# Altium project Studio_Clock_hv1.PrjPcb (part 3 of 3)

## Sheet POWER_Supply.SchDoc
size A3; SheetNumber: 10; SheetTotal: 16
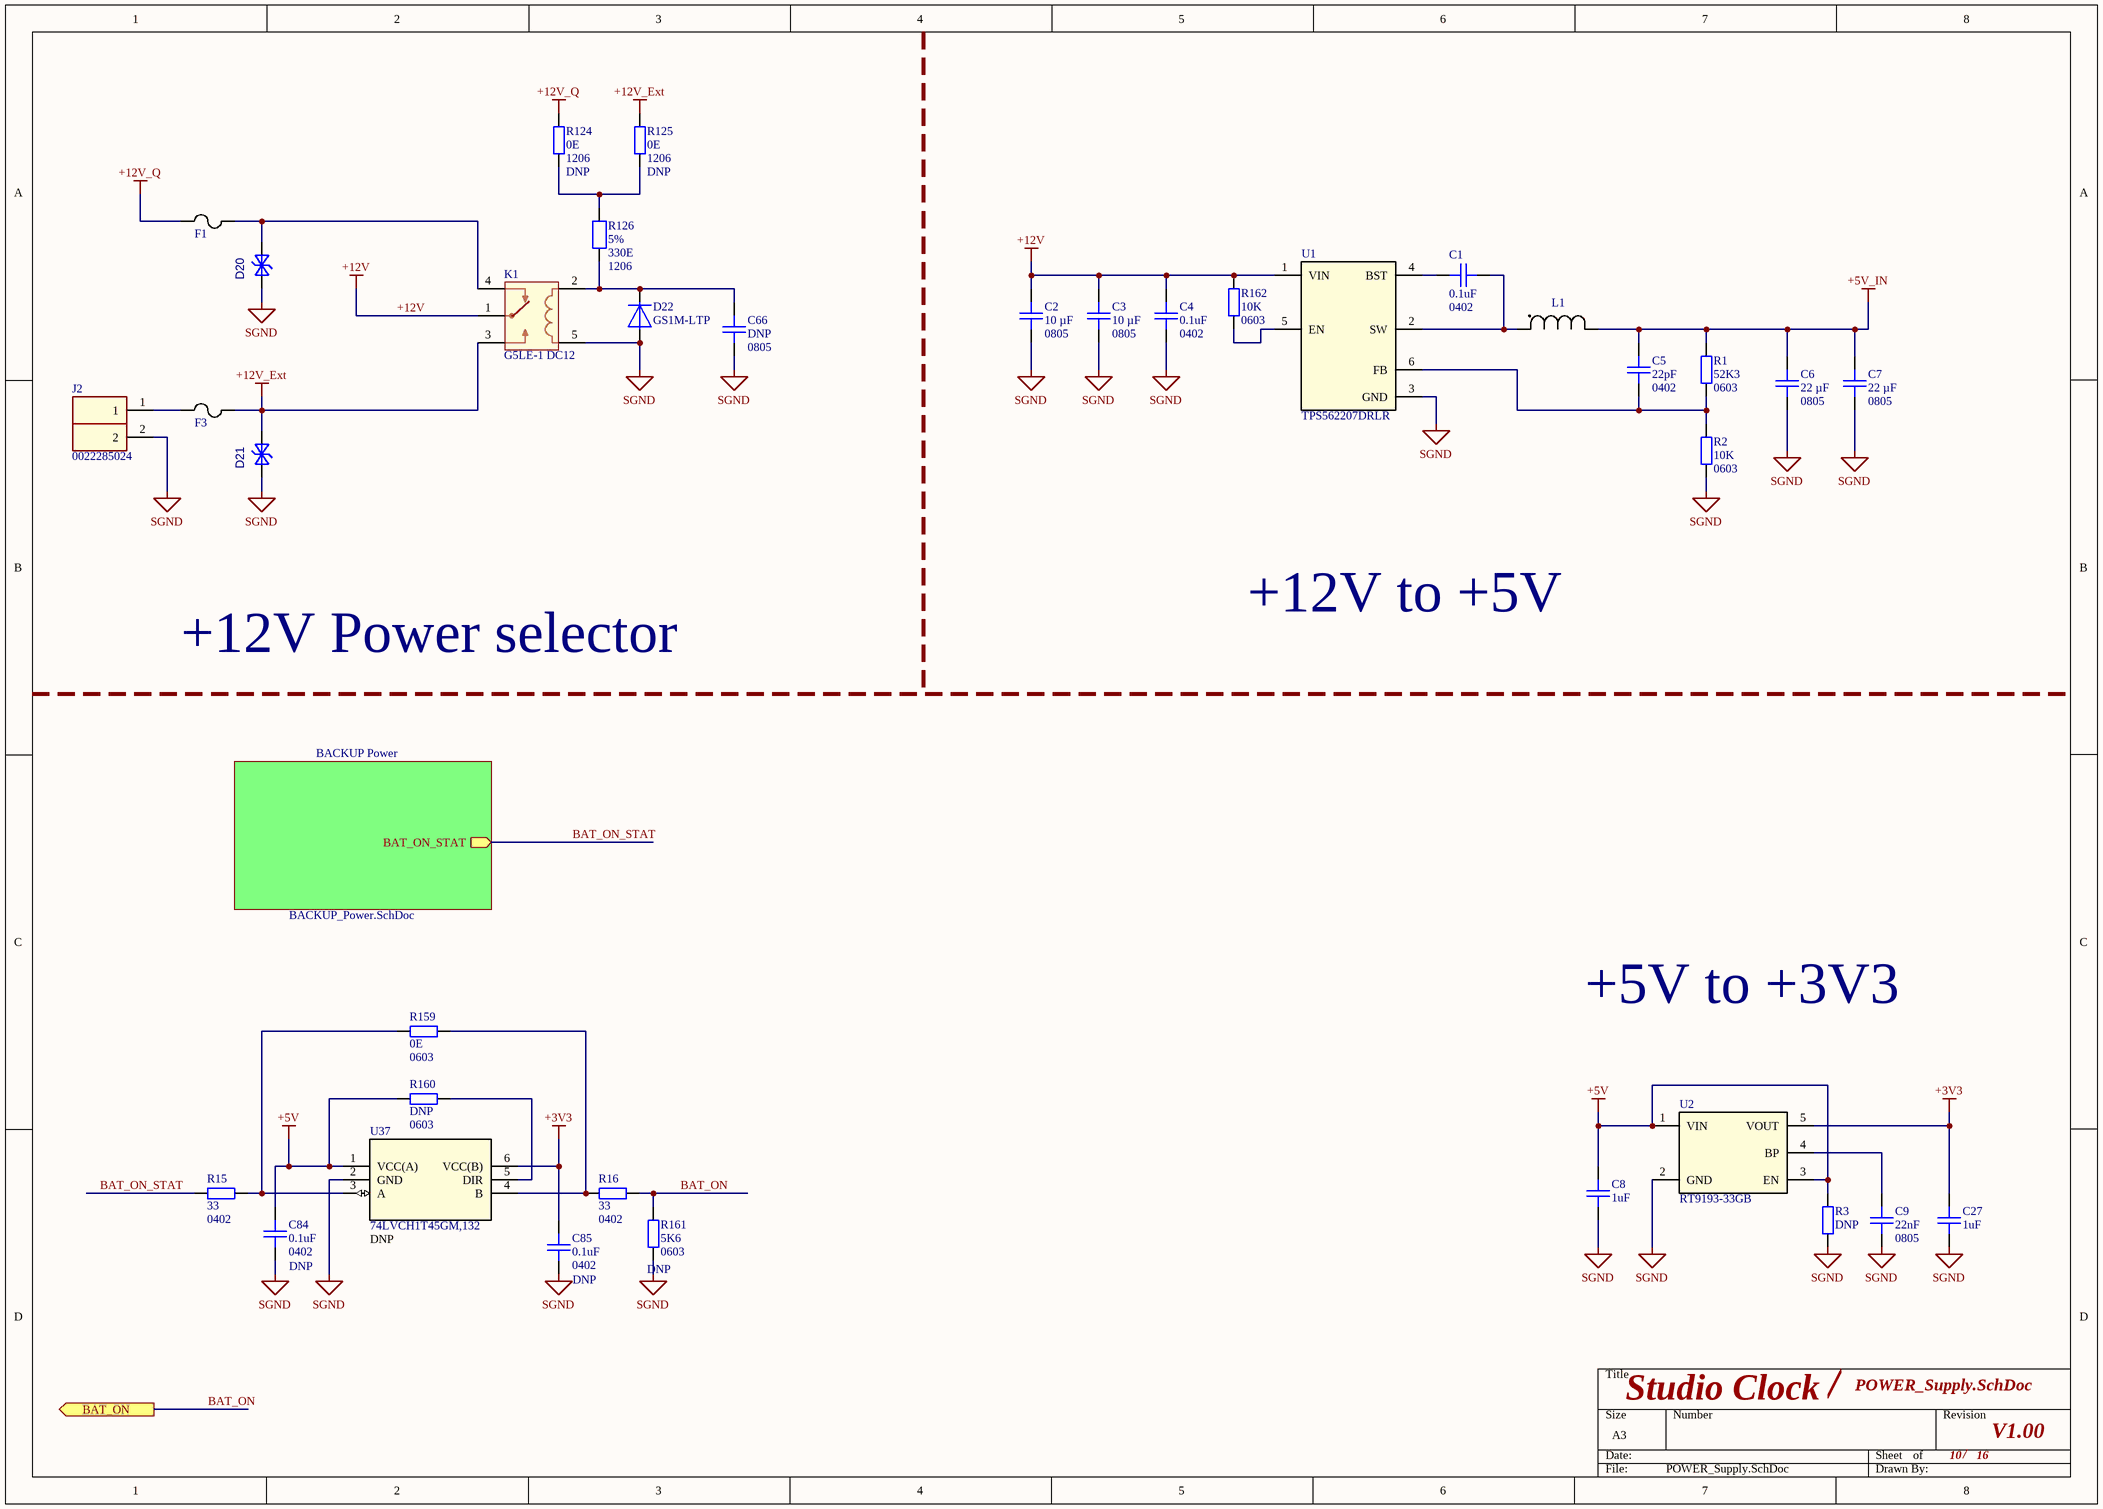
[diagram p13: POWER_Supply.SchDoc]

### Parts
C1  Capacitance: 0.1uF  Package1: 0402  [CAPC100x50x50L25]  (hidden comment: 04023C104KAT2A)
C2  Capacitance: 10 µF  Size2: 0805  [CAPC200X125X125L50]  (hidden comment: CC0805KKX5R8BB106)
C3  Capacitance: 10 µF  Size2: 0805  [CAPC200X125X125L50]  (hidden comment: CC0805KKX5R8BB106)
C4  Capacitance: 0.1uF  Package1: 0402  [CAPC100x50x50L25]  (hidden comment: 04023C104KAT2A)
C5  Capacitance: 22pF  Package1: 0402  [CAPC100x50x50L25]  (hidden comment: CC0402JRNPO9BN220)
C6  Capacitance: 22 µF  Size2: 0805  [CAPC200X125X125L50]  (hidden comment: GRT21BR61E226ME13L)
C7  Capacitance: 22 µF  Size2: 0805  [CAPC200X125X125L50]  (hidden comment: GRT21BR61E226ME13L)
C8  Capacitance: 1uF  [CAPC160X80X90L35]  (hidden comment: 0603YD105KAT2A)
C9  Capacitance: 22nF  SIZE2: 0805  [CAPC200X125X125L50]  (hidden comment: CC0805KRX7R9BB223)
C27  Capacitance: 1uF  [CAPC160X80X90L35]  (hidden comment: 0603YD105KAT2A)
C66  Capacitance: DNP  Size2: 0805  [CAPC200X125X125L50]
C84  Capacitance: 0.1uF  Package1: 0402  [CAPC100x50x50L25]  (hidden comment: DNP)
C85  Capacitance: 0.1uF  Package1: 0402  [CAPC100x50x50L25]  (hidden comment: DNP)
D20  SMAJ14CA-13-F  [SMA]  (value not drawn)
D21  SMAJ14CA-13-F  [SMA]  (value not drawn)
D22  GS1M-LTP  [DIOM520X260X290XL115X145]
F1  0ZCG0200AF2B  [Fuse_1812_ZCG_BEL]  (value not drawn)
F3  0ZCG0200AF2B  [Fuse_1812_ZCG_BEL]  (value not drawn)
J2  0022285024  [PLS-02]
K1  G5LE-1 DC12  [RELAY_G5LE-1 DC5_OMR]
L1  74437349047  [IND_7050-WE-LHMI_WRE]  (value not drawn)
R1  Resistance: 52K3  Size2: 0603  [RESC160X80X55L30]  (hidden comment: RC0603FR-0752K3L)
R2  Resistance: 10K  Size2: 0603  [RESC160X80X55L30]  (hidden comment: RC0603FR-0710KL)
R3  DNP  [RESC100X50X40L25]
R15  Resistance: 33  Package2: 0402  [RESC100X50X40L25]  (hidden comment: RC0402FR-0733RL)
R16  Resistance: 33  Package2: 0402  [RESC100X50X40L25]  (hidden comment: RC0402FR-0733RL)
R124  Resistance: 0E  Size2: 1206  PMNT: DNP  [RESC3116X06N]  (hidden comment: RC1206JR-070RL)
R125  Resistance: 0E  Size2: 1206  PMNT: DNP  [RESC3116X06N]  (hidden comment: RC1206JR-070RL)
R126  Tolerance: 5%  Resistance: 330E  Size: 1206  [RESC3116X06N]  (hidden comment: RC1206JR-07330RL)
R159  Resistance: 0E  Size2: 0603  [RESC160X80X55L30]  (hidden comment: RC0603FR-0710KL)
R160  Size2: 0603  [RESC160X80X55L30]  (hidden comment: DNP)
R161  Resistance: 5K6  Size2: 0603  [RESC160X80X55L30]  (hidden comment: CRCW06035K60JNEA)
R162  Resistance: 10K  Size2: 0603  [RESC160X80X55L30]  (hidden comment: RC0603FR-0710KL)
U1  TPS562207DRLR  [DRL0006A]
U2  RT9193-33GB  [SOT-23-5_RIT]
U37  74LVCH1T45GM,132  PMT: DNP  [74LVCH1T45_XSON6_NEX]

### Sub-sheets
BACKUP Power = BACKUP_Power.SchDoc: BAT_ON_STAT (out)

### Ports
BAT_ON (out)

### Nets
+3V3: C27.2 C85.2 U2.5(VOUT) U37.6(VCC(B))
+5V: C8.2 C84.2 R3.2 R160.2 U2.1(VIN) U2.3(EN) U37.1(VCC(A))
+5V_IN: C5.1 C6.2 C7.2 L1.2 R1.2
+12V: C2.2 C3.2 C4.1 K1.1 R162.1 U1.1(VIN)
+12V_Ext: D21.2(K) F3.2 K1.3 R125.2
+12V_Q: F1.1 R124.2
SGND: C2.1 C3.1 C4.2 C6.1 C7.1 C8.1 C9.1 C27.1 C66.1 C84.1 C85.1 D20.1(A) D21.1(A) D22.2 J2.2 K1.5 R2.1 R3.1 R161.1 U1.3(GND) U2.2(GND) U37.2(GND)
BAT_ON: R16.1 R161.2 ; port BAT_ON
BAT_ON_STAT: R15.2 ; sheet BACKUP Power/BAT_ON_STAT
NetC1_1: C1.1 L1.1 U1.2(SW)
NetC1_2: C1.2 U1.4(BST)
NetC5_2: C5.2 R1.1 R2.2 U1.6(FB)
NetC9_2: C9.2 U2.4(BP)
NetC66_2: C66.2 D22.1 K1.2 R126.2
NetD20_2: D20.2(K) F1.2 K1.4
NetF3_1: F3.1 J2.1
NetR15_1: R15.1 R159.2 U37.3(A)
NetR16_2: R16.2 R159.1 U37.4(B)
NetR124_1: R124.1 R125.1 R126.1
NetR160_1: R160.1 U37.5(DIR)
NetR162_2: R162.2 U1.5(EN)

### Notes on the sheet
- +12V to +5V
- +12V Power selector
- +5V to +3V3
- /

### Library data of the parts
C1 C4 C84 C85 = CMP-001-0374-4: 0402 25V X7R 100 NF 10%; Manufacturer: KYOCERA AVX; Op Temp max: 85°C; Op Temp min: -55°C; ComponentLink3URL: https://www.digikey.com/en/products/detail/yageo/CC0402MRX5R5BB106/5195138; ComponentLink1URL: https://www.yageo.com/upload/media/product/productsearch/datasheet/mlcc/UPY-GPHC_X5R_4V-to-50V_26.pdf; Package: 0402 (1005 Metric); Size: 1.00mm x 0.50mm; Height max: 700µm; Mounting Type: SM; Tolerance: 10%; ComponentLink1Description: Datasheet; ComponentLink3Description: Digikey; Ratings: -; Dielectric: X7R; ComponentLink2Description: Mouser; ComponentLink2URL: https://eu.mouser.com/ProductDetail/YAGEO/CC0402MRX5R5BB106?qs=zEY9bCHj09eCmUJdZuS5Lg%3D%3D; Lead Spacing: 0mm; Component Type: Ceramic Capacitor; Voltage Rating: 25V
  C1 C4: MPN: 04023C104KAT2A
  C84 C85: MPN: DNP; DNP: DNP
C2 C3 = CMP-001-1415-2: CAP CER 10UF 25V X5R 0805; Manufacturer: YAGEO; Op Temp max: 125°C; Op Temp min: -55°C; Tolerance: ±10%; Voltage Rating: 25V; Mounting Type: SM; MPN: CC0805KKX5R8BB106; Package: 0805 (2012 Metric); Dielectric: X5R; ComponentLink3Description: Digikey; ComponentLink1Description: Datasheet; Component Type: Ceramic Capacitor
  C2: ComponentLink1URL: https://www.yageo.com/upload/media/product/app/datasheet/mlcc/upy-gphc_x7r_6_3v-to-250v.pdf; ComponentLink3URL: https://www.digikey.ee/en/products/detail/yageo/cc0805krx7r9bb223/302872
  C3: ComponentLink1URL: https://www.yageo.com/upload/media/product/app/datasheet/mlcc/upy-gphc_x5r_4v-to-50v.pdf; ComponentLink3URL: https://www.digikey.com/en/products/detail/yageo/CC0805KKX5R8BB106/5195275
C5 = CMP-001-0374-4: CAP CER 22PF 50V C0G/NPO 0402; Manufacturer: YAGEO; Op Temp max: 125°C; Op Temp min: -55°C; Tolerance: 5%; Dielectric: C0G, NP0; ComponentLink3URL: https://www.digikey.com/en/products/detail/yageo/CC0402JRNPO9BN220/302752; MPN: CC0402JRNPO9BN220; ComponentLink1URL: https://www.yageo.com/upload/media/product/productsearch/datasheet/mlcc/UPY-GP_NP0_16V-to-50V_18.pdf; Package: 0402 (1005 Metric); Size: 1.00mm x 0.50mm; Height max: 700µm; Mounting Type: SM; ComponentLink1Description: Datasheet; ComponentLink3Description: Digikey; Ratings: -; Lead Spacing: 0mm; Component Type: Ceramic Capacitor; Voltage Rating: 50V
C6 C7 = CMP-001-1415-2: CAP CER 22UF 25V X5R 0805; Manufacturer: YAGEO; Op Temp max: 125°C; Op Temp min: -55°C; Tolerance: ±20%; Voltage Rating: 25V; ComponentLink1URL: https://search.murata.co.jp/Ceramy/image/img/A01X/G101/ENG/GRT21BR61E226ME13-01.pdf; ComponentLink3URL: https://www.digikey.com/en/products/detail/murata-electronics/GRT21BR61E226ME13L/5416811; Mounting Type: SM; MPN: GRT21BR61E226ME13L; Package: 0805 (2012 Metric); Dielectric: X5R; ComponentLink3Description: Digikey; ComponentLink1Description: Datasheet; Component Type: Ceramic Capacitor
C8 C27 = CMP-00119-5: CAP CER 1UF 16V X5R 0603; Manufacturer: KYOCERA AVX; Op Temp min: -55°C; Op Temp max: 85°C; Tolerance: 10%; ComponentLink1Description: Datasheet; MPN: 0603YD105KAT2A; ComponentLink2Description: Mouser; Ratings: -; Size: 1.60mm x 0.80mm; ComponentLink1URL: https://eu.mouser.com/datasheet/2/40/cx5r_KGM-3223198.pdf; Package: 0603 (1608 Metric); Dielectric: X5R; Voltage Rating: 16V; ComponentLink2URL: https://eu.mouser.com/ProductDetail/KYOCERA-AVX/0603YD105KAT2A?qs=Gc704lYbI0yxwip%252B5td8dA%3D%3D; Mounting Type: SM; Component Type: Ceramic Capacitor
C9 = CMP-001-1415-2: CAP CER 0.022UF 50V X7R 0805; MPN: CL21B104KBCNNNC; Manufacturer: Samsung Electro-Mechanics; Op Temp max: 125°C; Op Temp min: -55°C; Tolerance: ±10%; Voltage Rating: 50V; ComponentLink1URL: https://www.yageo.com/upload/media/product/app/datasheet/mlcc/upy-gphc_x7r_6_3v-to-250v.pdf; ComponentLink3URL: https://www.digikey.ee/en/products/detail/yageo/cc0805krx7r9bb223/302872; Mounting Type: SM; Package: 0805 (2012 Metric); Dielectric: X7R; ComponentLink3Description: Digikey; ComponentLink1Description: Datasheet; Ratings: -; Component Type: Ceramic Capacitor
C66 = CMP-001-1415-2: CAP CER ???? 50V X7R 0805; Manufacturer: Samsung Electro-Mechanics; Op Temp max: 125°C; Op Temp min: -55°C; Tolerance: ±10%; Voltage Rating: 50V; ComponentLink1URL: https://www.yageo.com/upload/media/product/app/datasheet/mlcc/upy-gphc_x7r_6_3v-to-250v.pdf; ComponentLink3URL: https://www.digikey.ee/en/products/detail/yageo/cc0805krx7r9bb223/302872; Mounting Type: SM; Package: 0805 (2012 Metric); Dielectric: X7R; ComponentLink3Description: Digikey; ComponentLink1Description: Datasheet; Component Type: Ceramic Capacitor; DNP: DNP
D20 D21 = SMAJ*C: TVS DIODE 14VWM 23.2VC SMA; MPN: SMAJ14CA-13-F
D22 = GS1M-LTP: DIODE GEN PURP 1KV 1A DO214AC; Manufacturer: Micro Commercial Co; Voltage - Forward (Vf) (Max) @ If: 1.1 V @ 1 A; Capacitance: 15pF @ 4V, 1MHz; Voltage - DC Reverse (Vr) (Max): 1000 V; Mounting Type: SM; ComponentLink3Description: Digikey; ComponentLink1Description: Datasheet; Diode Type: Diode; ComponentLink1URL: https://www.smc-diodes.com/propdf/1N4001FL-1N4007FL%20N1646%20REV.A.pdf; Package: DO-214AC, SMA; ComponentLink3URL: https://www.digikey.com/en/products/detail/micro-commercial-co/GS1M-LTP/2213582; Current - Average Rectified (Io): 1A; MPN: GS1M-LTP
F1 F3 = 0ZCG0200AF2B: PTC RESET FUSE 16V 2A 1812; Mfr_Name: Belfuse; Current - Trip (It): 3.5A; Resistance - Initial (Ri) (Min): 20 mOhms; Current - Hold (Ih) (Max): 2 A; MPN: 0ZCG0200AF2B; Voltage - Max: 16V; ComponentLink1Description: DigiKey; ComponentLink1URL: https://www.digikey.pl/en/products/detail/bel-fuse-inc/0ZCG0200AF2B/6210545; ComponentLink2Description: Datasheet; ComponentLink2URL: https://www.belfuse.com/resources/datasheets/circuitprotection/ds-cp-0zcg-series.pdf
J2 = PLS_02: CONN HEADER VERT 2POS 2.54MM; MAnufacturer: MOLEX; MPN: 0022285024
K1 = G5LE-1 DC12: RELAY GEN PURPOSE SPDT 10A 12V; Mfr_Name: Omron Electronics Inc-EMC Div; Copyright: Copyright (C) 2024 Ultra Librarian. All rights reserved.; MPN: G5LE-1 DC12; RefDes: RefDes; Type: DEV
L1 = IND_WE_74437349047: FIXED IND 4.7UH 5A 30.8 MOHM SMD; Mfr_Name: Wurth Electronics; Inductance: 4.7 µH; Current - Saturation (Isat): 11A; DC Resistance (DCR): 30.8mOhm Max; Manufacturer_Part_Number: 74437349047; Current Rating (Amps): 5 A; ComponentLink1Description: Datasheet; ComponentLink1URL: https://we-online.com/components/products/datasheet/74437349047.pdf; ComponentLink2Description: DigiKey; ComponentLink2URL: https://www.digikey.com/en/products/detail/w%C3%BCrth-elektronik/74437349047/2790977
R1 = CMP-001-0628-7: RES 52.3 KOHM 1% 1/10W 0603; Manufacturer: YAGEO; Power: 100mW; Temperature Coefficient: ±100ppm; Op Temp max: 155°C; Op Temp min: -55°C; Ratings: -; ComponentLink3URL: https://www.digikey.com/en/products/detail/yageo/RC0603FR-0710KL/726880?s=N4IgTCBcDaIEoGEAMA2JBmAYnAtEg7AIxIDSAMiALoC%2BQA; Size: 1.60mm x 0.80mm; ComponentLink1Description: Datasheet; ComponentLink3Description: Digikey; ComponentLink2Description: Mouser; ComponentLink1URL: https://www.yageo.com/upload/media/product/products/datasheet/rchip/PYu-RC_51_RoHS_P_4.pdf; Composition: Thick Film; Package: 0603 (1608 Metric); ComponentLink2URL: https://eu.mouser.com/ProductDetail/YAGEO/RC0603FR-0710KL?qs=grNVn54RoB%252B3GtjbJj3wJQ%3D%3D; Mounting Type: SM; Tolerance: 1%; Height max: 550µm; MPN: RC0603FR-0752K3L; Component Type: Chip Resistor
R2 R162 = CMP-001-0628-7: RES 10K OHM 1% 1/10W 0603; Manufacturer: YAGEO; Power: 100mW; Temperature Coefficient: ±100ppm; Op Temp max: 155°C; Op Temp min: -55°C; PMNT: DNP; Ratings: -; ComponentLink3URL: https://www.digikey.com/en/products/detail/yageo/RC0603FR-0710KL/726880?s=N4IgTCBcDaIEoGEAMA2JBmAYnAtEg7AIxIDSAMiALoC%2BQA; Size: 1.60mm x 0.80mm; ComponentLink1Description: Datasheet; ComponentLink3Description: Digikey; ComponentLink2Description: Mouser; ComponentLink1URL: https://www.yageo.com/upload/media/product/products/datasheet/rchip/PYu-RC_51_RoHS_P_4.pdf; Composition: Thick Film; Package: 0603 (1608 Metric); ComponentLink2URL: https://eu.mouser.com/ProductDetail/YAGEO/RC0603FR-0710KL?qs=grNVn54RoB%252B3GtjbJj3wJQ%3D%3D; Mounting Type: SM; Tolerance: 1%; Height max: 550µm; MPN: RC0603FR-0710KL; Component Type: Chip Resistor
R3 = CMP-001-0484-6: RES SMD 0 OHM JUMPER 1/16W 0402; Manufacturer: YAGEO; Power: 63mW; Op Temp min: -55°C; Temperature Coefficient: ±100ppm; Resistance: 0; Op Temp max: 155°C; ComponentLink3URL: https://www.digikey.com/en/products/detail/yageo/RC0402FR-0727RL/5280946; ComponentLink2Description: Mouser; Ratings: -; Tolerance: Jumper; Height max: 400µm; MPN: DNP; ComponentLink1URL: https://www.yageo.com/upload/media/product/productsearch/datasheet/rchip/PYu-RC_Group_51_RoHS_L_12.pdf; Size: 1.00mm x 0.50mm; Composition: Thick Film; Package: 0402 (1005 Metric); ComponentLink3Description: Digikey; Mounting Type: SM; ComponentLink2URL: https://eu.mouser.com/ProductDetail/YAGEO/RC0402FR-0727RL?qs=UOUeRUa%252B8Wlb37UyFHw9Bw%3D%3D; ComponentLink1Description: Datasheet; Component Type: Chip Resistor
R15 R16 = CMP-001-0484-6: RES 33 OHM 1% 1/16W 0402; Manufacturer: YAGEO; Power: 63mW; Op Temp min: -55°C; Temperature Coefficient: ±100ppm; Op Temp max: 155°C; ComponentLink3URL: https://www.digikey.com/en/products/detail/yageo/RC0402FR-0727RL/5280946; ComponentLink2Description: Mouser; Ratings: -; Tolerance: 1%; Height max: 400µm; MPN: RC0402FR-0733RL; ComponentLink1URL: https://www.yageo.com/upload/media/product/productsearch/datasheet/rchip/PYu-RC_Group_51_RoHS_L_12.pdf; Size: 1.00mm x 0.50mm; Composition: Thick Film; Package: 0402 (1005 Metric); ComponentLink3Description: Digikey; Mounting Type: SM; ComponentLink2URL: https://eu.mouser.com/ProductDetail/YAGEO/RC0402FR-0727RL?qs=UOUeRUa%252B8Wlb37UyFHw9Bw%3D%3D; ComponentLink1Description: Datasheet; Component Type: Chip Resistor
R124 R125 = RC_1206: RES 0 OHM JUMPER 1/4W 1206; MF: YAGEO; Power: 0.25W; Datasheet: https://www.yageo.com/upload/media/product/products/datasheet/rchip/PYu-RC_Group_51_RoHS_L_12.pdf; DigiKey: https://www.digikey.com/en/products/detail/yageo/RC1206JR-070RL/729184; Package: 1206 (3216 Metric); MPN: RC1206JR-070RL; DNP: DNP
R126 = RT1206BRD07100RL: RES 330 OHM 5% 1/4W 1206; MF: YAGEO; Power: 0.25W; Datasheet: https://www.yageo.com/upload/media/product/app/datasheet/rchip/pyu-rt_1-to-0.01_rohs_l.pdf; DigiKey: https://www.digikey.sk/en/products/detail/yageo/RT1206BRD07130RL/1079510; Package: 1206 (3216 Metric); MPN: RC1206JR-07330RL
R159 = CMP-001-0628-7: RES 0 OHM JUMPER 1/10W 0603; Manufacturer: YAGEO; Power: 100mW; Temperature Coefficient: ±100ppm; Tolerance: 1%; Op Temp max: 155°C; Op Temp min: -55°C; PMNT: DNP; Ratings: -; ComponentLink3URL: https://www.digikey.com/en/products/detail/yageo/RC0603FR-0710KL/726880?s=N4IgTCBcDaIEoGEAMA2JBmAYnAtEg7AIxIDSAMiALoC%2BQA; Size: 1.60mm x 0.80mm; ComponentLink1Description: Datasheet; ComponentLink3Description: Digikey; ComponentLink2Description: Mouser; ComponentLink1URL: https://www.yageo.com/upload/media/product/products/datasheet/rchip/PYu-RC_51_RoHS_P_4.pdf; Composition: Thick Film; Package: 0603 (1608 Metric); ComponentLink2URL: https://eu.mouser.com/ProductDetail/YAGEO/RC0603FR-0710KL?qs=grNVn54RoB%252B3GtjbJj3wJQ%3D%3D; Mounting Type: SM; Height max: 550µm; MPN: RC0603FR-0710KL; Component Type: Chip Resistor
R160 = CMP-001-0628-7: RES 0 OHM JUMPER 1/10W 0603; Manufacturer: YAGEO; MPN: RC0603FR-0710KL; Power: 100mW; Temperature Coefficient: ±100ppm; Tolerance: 1%; Op Temp max: 155°C; Op Temp min: -55°C; Ratings: -; ComponentLink3URL: https://www.digikey.com/en/products/detail/yageo/RC0603FR-0710KL/726880?s=N4IgTCBcDaIEoGEAMA2JBmAYnAtEg7AIxIDSAMiALoC%2BQA; Size: 1.60mm x 0.80mm; ComponentLink1Description: Datasheet; ComponentLink3Description: Digikey; ComponentLink2Description: Mouser; ComponentLink1URL: https://www.yageo.com/upload/media/product/products/datasheet/rchip/PYu-RC_51_RoHS_P_4.pdf; Resistance: DNP; Composition: Thick Film; Package: 0603 (1608 Metric); ComponentLink2URL: https://eu.mouser.com/ProductDetail/YAGEO/RC0603FR-0710KL?qs=grNVn54RoB%252B3GtjbJj3wJQ%3D%3D; Mounting Type: SM; Height max: 550µm; Component Type: Chip Resistor; PMNT: DNP; DNP: DNP
R161 = CMP-001-0628-7: RES SMD 5.6K OHM 5% 1/10W 0603; Manufacturer: YAGEO; MPN: DNP; Power: 100mW; Temperature Coefficient: ±100ppm; Tolerance: 1%; Op Temp max: 155°C; Op Temp min: -55°C; Ratings: -; ComponentLink3URL: https://www.digikey.com/en/products/detail/yageo/RC0603FR-0710KL/726880?s=N4IgTCBcDaIEoGEAMA2JBmAYnAtEg7AIxIDSAMiALoC%2BQA; Size: 1.60mm x 0.80mm; ComponentLink1Description: Datasheet; ComponentLink3Description: Digikey; ComponentLink2Description: Mouser; ComponentLink1URL: https://www.yageo.com/upload/media/product/products/datasheet/rchip/PYu-RC_51_RoHS_P_4.pdf; Composition: Thick Film; Package: 0603 (1608 Metric); ComponentLink2URL: https://eu.mouser.com/ProductDetail/YAGEO/RC0603FR-0710KL?qs=grNVn54RoB%252B3GtjbJj3wJQ%3D%3D; Mounting Type: SM; Height max: 550µm; Component Type: Chip Resistor; DNP: DNP
U1 = TPS562207DRLR: IC REG BUCK ADJ 2A SOT563; Mfr_Name: Texas Instruments; Voltage - Input (Max): 17V; Voltage - Input (Min): 4.3V; Frequency - Switching: 580kHz; Current - Output: 2A; MPN: TPS562207DRLR; ComponentLink1Description: DigiKey; ComponentLink1URL: https://www.digikey.com/en/products/detail/texas-instruments/tps562207drlr/13213542
U2 = RT9193-33GB: IC REG LINEAR 3.3V 300MA SOT23-5; Mfr_Name: Richtek Technology; MPN: RT9193-33GB
U37 = 74LVCH1T45GM,132: IC TRANSLTR BIDIRECTIONAL 6XSON; Voltage min: 1.2 V; Moltage max: 5.5 V; MPN: 74LVCH1T45GM,132; DNP: DNP

## Sheet BACKUP_Power.SchDoc
size A3; SheetNumber: 11; SheetTotal: 16
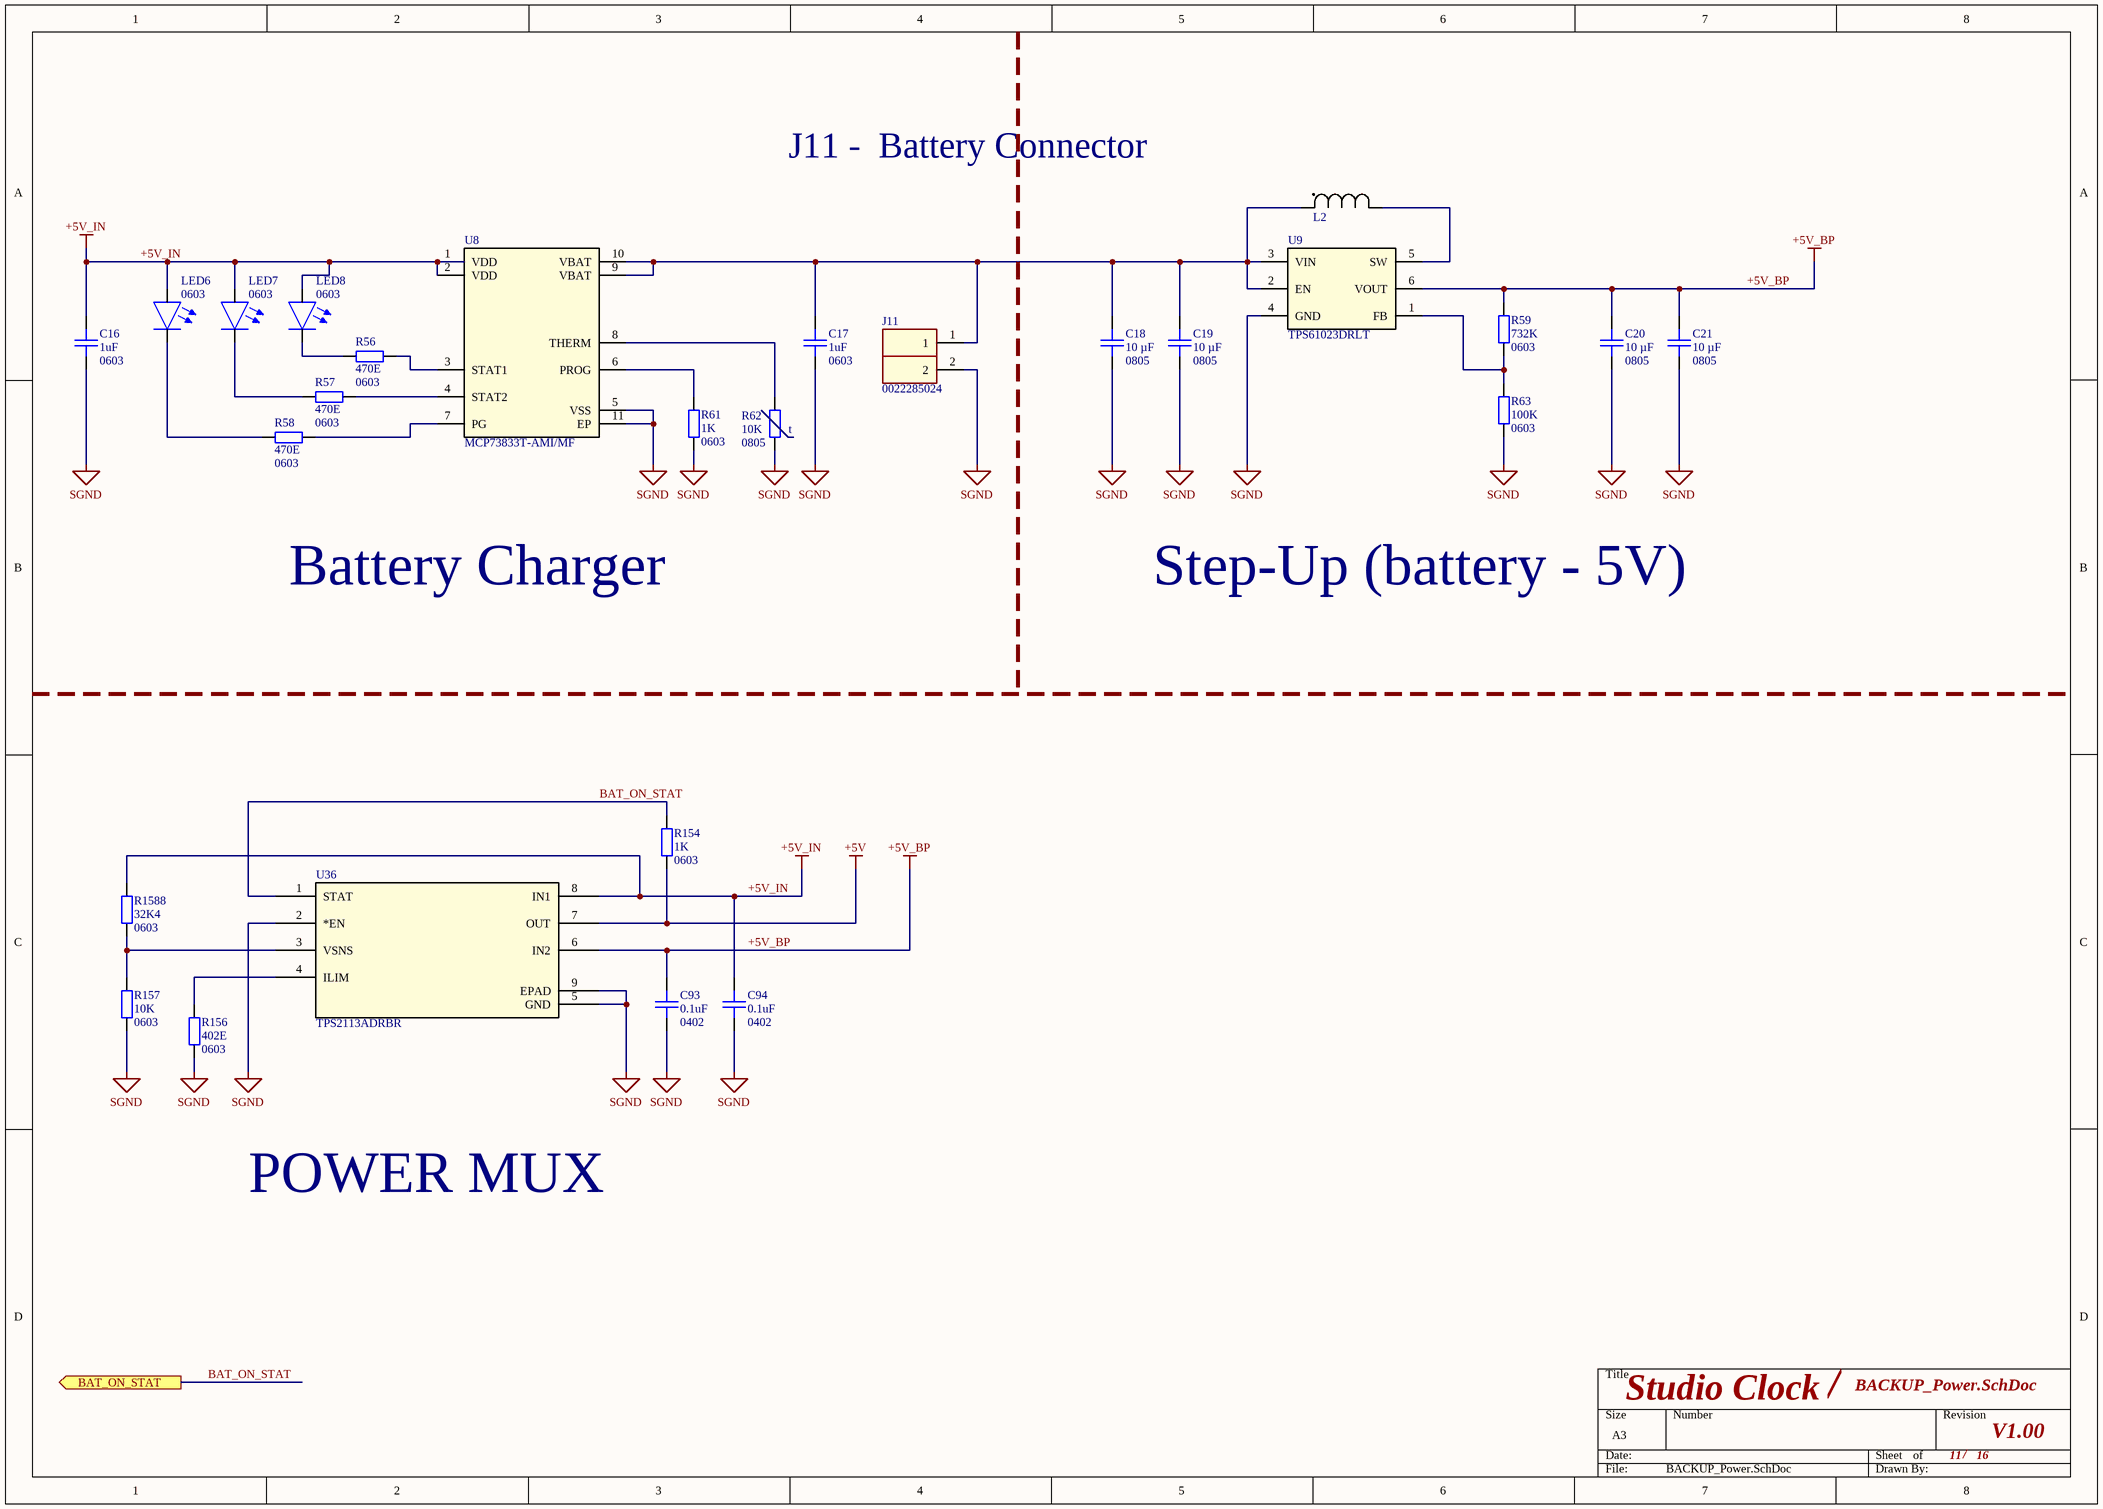
[diagram p14: BACKUP_Power.SchDoc]

### Parts
C16  Capacitance: 1uF  Size2: 0603  [CAPC160X80X90L35]  (hidden comment: KGM15AR71C105KT)
C17  Capacitance: 1uF  Size2: 0603  [CAPC160X80X90L35]  (hidden comment: KGM15AR71C105KT)
C18  Capacitance: 10 µF  Size2: 0805  [CAPC200X125X125L50]  (hidden comment: CC0805KKX5R8BB106)
C19  Capacitance: 10 µF  Size2: 0805  [CAPC200X125X125L50]  (hidden comment: CC0805KKX5R8BB106)
C20  Capacitance: 10 µF  Size2: 0805  [CAPC200X125X125L50]  (hidden comment: CC0805KKX5R8BB106)
C21  Capacitance: 10 µF  Size2: 0805  [CAPC200X125X125L50]  (hidden comment: CC0805KKX5R8BB106)
C93  Capacitance: 0.1uF  Package1: 0402  [CAPC100x50x50L25]  (hidden comment: 04023C104KAT2A)
C94  Capacitance: 0.1uF  Package1: 0402  [CAPC100x50x50L25]  (hidden comment: 04023C104KAT2A)
J11  0022285024  [PLS-02]
L2  XEL4030-101MEB  [IND_XEL4030_3.2_COC]  (value not drawn)
LED6  Size: 0603  [LED_0603(1608)]  (hidden comment: 150060GS75000)
LED7  Size: 0603  [LED_0603(1608)]  (hidden comment: 150060GS75000)
LED8  Size: 0603  [LED_0603(1608)]  (hidden comment: 150060GS75000)
R56  Resistance: 470E  Size2: 0603  [RESC160X80X55L30]  (hidden comment: RC0603FR-07470RL)
R57  Resistance: 470E  Size2: 0603  [RESC160X80X55L30]  (hidden comment: RC0603FR-07470RL)
R58  Resistance: 470E  Size2: 0603  [RESC160X80X55L30]  (hidden comment: RC0603FR-07470RL)
R59  Resistance: 732K  Size2: 0603  [RESC160X80X55L30]  (hidden comment: RC0603FR-07732KL)
R61  Resistance: 1K  Size2: 0603  [RESC160X80X55L30]  (hidden comment: RC0603FR-071KL)
R62  Resistance: 10K  Size2: 0805  [RESC200X125X60L40]  (hidden comment: NTCS0805E3103HMT)
R63  Resistance: 100K  Size2: 0603  [RESC160X80X55L30]  (hidden comment: RC0603FR-07100KL)
R154  Resistance: 1K  Size2: 0603  [RESC160X80X55L30]  (hidden comment: RC0603FR-071KL)
R156  Resistance: 402E  Size2: 0603  [RESC160X80X55L30]  (hidden comment: RC0603FR-07402RP)
R157  Resistance: 10K  Size2: 0603  [RESC160X80X55L30]  (hidden comment: RC0603FR-0710KL)
R1588  Resistance: 32K4  Size2: 0603  [RESC160X80X55L30]  (hidden comment: RC0603FR-0732K4L)
U8  MCP73833T-AMI/MF  [DFN10_3x3MC_MCH]
U9  TPS61023DRLT  [DRL0006A]
U36  TPS2113ADRBR  [DRB8_2P4X1P65]

### Ports
BAT_ON_STAT (out)

### Nets
+5V: R154.2 U36.7(OUT)
+5V_BP: C20.2 C21.2 C93.1 R59.1 U9.6(VOUT) U36.6(IN2)
+5V_IN: C16.2 C94.1 LED6.1(Anode) LED7.1(Anode) LED8.1(Anode) R1588.1 U8.1(VDD) U8.2(VDD) U36.8(IN1)
SGND: C16.1 C17.1 C18.1 C19.1 C20.1 C21.1 C93.2 C94.2 J11.2 R61.2 R62.1 R63.2 R156.2 R157.2 U8.5(VSS) U8.11(EP) U9.4(GND) U36.2(*EN) U36.5(GND) U36.9(EPAD)
BAT_ON_STAT: R154.1 U36.1(STAT) ; port BAT_ON_STAT
NetC17_2: C17.2 C18.2 C19.2 J11.1 L2.2 U8.9(VBAT) U8.10(VBAT) U9.2(EN) U9.3(VIN)
NetL2_1: L2.1 U9.5(SW)
NetLED6_2: LED6.2(Chatode) R58.2
NetLED7_2: LED7.2(Chatode) R57.2
NetLED8_2: LED8.2(Chatode) R56.2
NetR56_1: R56.1 U8.3(STAT1)
NetR57_1: R57.1 U8.4(STAT2)
NetR58_1: R58.1 U8.7(PG)
NetR59_2: R59.2 R63.1 U9.1(FB)
NetR61_1: R61.1 U8.6(PROG)
NetR62_2: R62.2 U8.8(THERM)
NetR156_1: R156.1 U36.4(ILIM)
NetR157_1: R157.1 R1588.2 U36.3(VSNS)

### Notes on the sheet
- J11 -  Battery Connector
- (near R62) t
- Battery Charger
- Step-Up (battery - 5V)
- POWER MUX
- /

### Library data of the parts
C16 C17 = CMP-00119-5: CAP CER 1UF 16V X7R 0603; Manufacturer: KYOCERA AVX; Op Temp min: -55°C; Op Temp max: 125°C; Tolerance: 10%; ComponentLink3URL: https://www.digikey.ee/en/products/detail/kyocera-avx/kgm15ar71c105kt/10815111; ComponentLink1Description: Datasheet; MPN: KGM15AR71C105KT; Lead Spacing: 0mm; Ratings: -; Size: 1.60mm x 0.80mm; ComponentLink1URL: https://datasheets.kyocera-avx.com/KGM_X7R.pdf; Package: 0603 (1608 Metric); Dielectric: X7R; ComponentLink3Description: Digikey; Voltage Rating: 16V; Height max: 900µm; Mounting Type: SM; Component Type: Ceramic Capacitor
C18-C21 = CMP-001-1415-2: as C2 on sheet POWER_Supply; Voltage Rating: 25V; Mounting Type: SM; MPN: CC0805KKX5R8BB106; Package: 0805 (2012 Metric); Dielectric: X5R; ComponentLink3Description: Digikey; ComponentLink1Description: Datasheet; Component Type: Ceramic Capacitor
  C18 C20: ComponentLink1URL: https://www.yageo.com/upload/media/product/app/datasheet/mlcc/upy-gphc_x7r_6_3v-to-250v.pdf; ComponentLink3URL: https://www.digikey.ee/en/products/detail/yageo/cc0805krx7r9bb223/302872
  C19 C21: ComponentLink1URL: https://www.yageo.com/upload/media/product/app/datasheet/mlcc/upy-gphc_x5r_4v-to-50v.pdf; ComponentLink3URL: https://www.digikey.com/en/products/detail/yageo/CC0805KKX5R8BB106/5195275
C93 C94 = CMP-001-0374-4: as C1 on sheet POWER_Supply; ComponentLink3URL: https://www.digikey.com/en/products/detail/yageo/CC0402MRX5R5BB106/5195138; MPN: 04023C104KAT2A; ComponentLink1URL: https://www.yageo.com/upload/media/product/productsearch/datasheet/mlcc/UPY-GPHC_X5R_4V-to-50V_26.pdf; Package: 0402 (1005 Metric); Size: 1.00mm x 0.50mm; Height max: 700µm; Mounting Type: SM; Tolerance: 10%; ComponentLink1Description: Datasheet; ComponentLink3Description: Digikey; Ratings: -; Dielectric: X7R; ComponentLink2Description: Mouser; ComponentLink2URL: https://eu.mouser.com/ProductDetail/YAGEO/CC0402MRX5R5BB106?qs=zEY9bCHj09eCmUJdZuS5Lg%3D%3D; Lead Spacing: 0mm; Component Type: Ceramic Capacitor; Voltage Rating: 25V
J11 = PLS_02: as J2 on sheet POWER_Supply; MPN: 0022285024
L2 = XEL4030-101MEB: FIXED IND 1UH 10.7A 9.78MOHM SM; Mfr_Name: Coilcraft; Tolerance: ±20%; Inductance: 1 µH; DC Resistance (DCR): 9.78mOhm Max; Current Rating (Amps): 10.7 A; MPN: XEL4030-101MEB; ComponentLink1Description: DigiKey; ComponentLink1URL: https://www.digikey.com/en/products/detail/coilcraft/xel4030-102mec/21381728; ComponentLink2Description: Datasheet; ComponentLink2URL: https://www.coilcraft.com/en-us/files/datasheet/XEL4030
LED6-LED8 = LED_0603_SMD: LED GREEN CLEAR 0603 SMD; MPN: 150060GS75000; ComponentLink1Description: DigiKey; ComponentLink1URL: https://www.digikey.com/en/products/detail/w%C3%BCrth-elektronik/150060gs75000/4489898
R56-R58 = CMP-001-0628-7: RES 470 OHM 1% 1/10W 0603; Manufacturer: YAGEO; Power: 100mW; Temperature Coefficient: ±100ppm; Op Temp max: 155°C; Op Temp min: -55°C; Ratings: -; ComponentLink3URL: https://www.digikey.com/en/products/detail/yageo/RC0603FR-0710KL/726880?s=N4IgTCBcDaIEoGEAMA2JBmAYnAtEg7AIxIDSAMiALoC%2BQA; Size: 1.60mm x 0.80mm; ComponentLink1Description: Datasheet; ComponentLink3Description: Digikey; ComponentLink2Description: Mouser; ComponentLink1URL: https://www.yageo.com/upload/media/product/products/datasheet/rchip/PYu-RC_51_RoHS_P_4.pdf; Composition: Thick Film; Package: 0603 (1608 Metric); ComponentLink2URL: https://eu.mouser.com/ProductDetail/YAGEO/RC0603FR-0710KL?qs=grNVn54RoB%252B3GtjbJj3wJQ%3D%3D; Mounting Type: SM; Tolerance: 1%; Height max: 550µm; MPN: RC0603FR-07470RL; Component Type: Chip Resistor
R59 = CMP-001-0628-7: RES 732K OHM 1% 1/10W 0603; Manufacturer: YAGEO; Power: 100mW; Temperature Coefficient: ±100ppm; Op Temp max: 155°C; Op Temp min: -55°C; Ratings: -; ComponentLink3URL: https://www.digikey.com/en/products/detail/yageo/rc0603fr-07732kl/727376; Size: 1.60mm x 0.80mm; ComponentLink1Description: Datasheet; ComponentLink3Description: Digikey; ComponentLink1URL: https://www.digikey.ee/en/products/detail/yageo/rc0603fr-07100rp/4935304; Composition: Thick Film; Package: 0603 (1608 Metric); Mounting Type: SM; Tolerance: 1%; Height max: 550µm; MPN: RC0603FR-07732KL; Component Type: Chip Resistor
R61 R154 = CMP-001-0628-7: RES 1K OHM 1% 1/10W 0603; Manufacturer: YAGEO; Power: 100mW; Temperature Coefficient: ±100ppm; Op Temp max: 155°C; Op Temp min: -55°C; Ratings: -; ComponentLink3URL: https://www.digikey.com/en/products/detail/yageo/RC0603FR-0710KL/726880?s=N4IgTCBcDaIEoGEAMA2JBmAYnAtEg7AIxIDSAMiALoC%2BQA; Size: 1.60mm x 0.80mm; ComponentLink1Description: Datasheet; ComponentLink3Description: Digikey; ComponentLink1URL: https://www.digikey.ee/en/products/detail/yageo/rc0603fr-07100rp/4935304; Composition: Thick Film; Package: 0603 (1608 Metric); Mounting Type: SM; Tolerance: 1%; Height max: 550µm; MPN: RC0603FR-071KL; Component Type: Chip Resistor
R62 = CMP-001-0694-4: THERMISTOR NTC 10KOHM 3570K 0805; Manufacturer: Vishay Beyschlag/Draloric/BC Components; Op Temp max: 155°C; Tolerance: ±3%; Package: 0805 (2012 Metric); MPN: NTCS0805E3103HMT; ComponentLink1Description: Datasheet; ComponentLink3Description: Digikey; Mounting Type: SM; ComponentLink3URL: https://www.digikey.com/en/products/detail/vishay-beyschlag-draloric-bc-components/ntcs0805e3103hmt/2237369; ComponentLink1URL: https://www.vishay.com/docs/29044/ntcs0805e3t.pdf; Component Type: Chip Resistor
R63 = CMP-001-0628-7: RES 100K OHM 1% 1/10W 0603; Manufacturer: YAGEO; Power: 100mW; Temperature Coefficient: ±100ppm; Op Temp max: 155°C; Op Temp min: -55°C; Ratings: -; ComponentLink3URL: https://www.digikey.com/en/products/detail/yageo/rc0603fr-07100kl/726889; Size: 1.60mm x 0.80mm; ComponentLink1Description: Datasheet; ComponentLink3Description: Digikey; ComponentLink1URL: https://www.digikey.ee/en/products/detail/yageo/rc0603fr-07100rp/4935304; Composition: Thick Film; Package: 0603 (1608 Metric); Mounting Type: SM; Tolerance: 1%; Height max: 550µm; MPN: RC0603FR-07100KL; Component Type: Chip Resistor
R156 = CMP-001-0628-7: RES 402 OHM 1% 1/10W 0603; Manufacturer: YAGEO; Power: 100mW; Temperature Coefficient: ±100ppm; Op Temp max: 155°C; Op Temp min: -55°C; PMNT: DNP; Ratings: -; ComponentLink3URL: https://www.digikey.com/en/products/detail/yageo/RC0603FR-0710KL/726880?s=N4IgTCBcDaIEoGEAMA2JBmAYnAtEg7AIxIDSAMiALoC%2BQA; Size: 1.60mm x 0.80mm; ComponentLink1Description: Datasheet; ComponentLink3Description: Digikey; ComponentLink2Description: Mouser; ComponentLink1URL: https://www.yageo.com/upload/media/product/products/datasheet/rchip/PYu-RC_51_RoHS_P_4.pdf; Composition: Thick Film; Package: 0603 (1608 Metric); ComponentLink2URL: https://eu.mouser.com/ProductDetail/YAGEO/RC0603FR-0710KL?qs=grNVn54RoB%252B3GtjbJj3wJQ%3D%3D; Mounting Type: SM; Tolerance: 1%; Height max: 550µm; MPN: RC0603FR-07402RP; Component Type: Chip Resistor
R157 = CMP-001-0628-7: as R2 on sheet POWER_Supply; Ratings: -; ComponentLink3URL: https://www.digikey.com/en/products/detail/yageo/RC0603FR-0710KL/726880?s=N4IgTCBcDaIEoGEAMA2JBmAYnAtEg7AIxIDSAMiALoC%2BQA; Size: 1.60mm x 0.80mm; ComponentLink1Description: Datasheet; ComponentLink3Description: Digikey; ComponentLink2Description: Mouser; ComponentLink1URL: https://www.yageo.com/upload/media/product/products/datasheet/rchip/PYu-RC_51_RoHS_P_4.pdf; Composition: Thick Film; Package: 0603 (1608 Metric); ComponentLink2URL: https://eu.mouser.com/ProductDetail/YAGEO/RC0603FR-0710KL?qs=grNVn54RoB%252B3GtjbJj3wJQ%3D%3D; Mounting Type: SM; Tolerance: 1%; Height max: 550µm; MPN: RC0603FR-0710KL; Component Type: Chip Resistor
R1588 = CMP-001-0628-7: RES 32.4K OHM 1% 1/10W 0603; Manufacturer: YAGEO; Power: 100mW; Temperature Coefficient: ±100ppm; Op Temp max: 155°C; Op Temp min: -55°C; PMNT: DNP; Ratings: -; ComponentLink3URL: https://www.digikey.com/en/products/detail/yageo/RC0603FR-0710KL/726880?s=N4IgTCBcDaIEoGEAMA2JBmAYnAtEg7AIxIDSAMiALoC%2BQA; Size: 1.60mm x 0.80mm; ComponentLink1Description: Datasheet; ComponentLink3Description: Digikey; ComponentLink2Description: Mouser; ComponentLink1URL: https://www.yageo.com/upload/media/product/products/datasheet/rchip/PYu-RC_51_RoHS_P_4.pdf; Composition: Thick Film; Package: 0603 (1608 Metric); ComponentLink2URL: https://eu.mouser.com/ProductDetail/YAGEO/RC0603FR-0710KL?qs=grNVn54RoB%252B3GtjbJj3wJQ%3D%3D; Mounting Type: SM; Tolerance: 1%; Height max: 550µm; MPN: RC0603FR-0732K4L; Component Type: Chip Resistor
U8 = MCP73833T-AMIMF: IC BATT CONTRL LI-ION 1CEL 10DFN; Mfr_Name: Microchip; Voltage - Supply (Max): 6V; Battery Pack Voltage: 4.2V; Charge Current - Max: 1.1A; MPN: MCP73833T-AMI/MF
U9 = TPS61023DRLT: IC REG BOOST ADJ 3A SOT563; Mfr_Name: Texas Instruments; Voltage - Input (Min): 0.5V; Voltage - Input (Max): 5.5V; Frequency - Switching: 1MHz; Current - Output: 3A; Manufacturer_Part_Number: TPS61023DRLT; ComponentLink1Description: DigiKey; ComponentLink1URL: https://www.digikey.com/en/products/detail/texas-instruments/tps61023drlt/11310622; ComponentLink2Description: Datasheet; ComponentLink2URL: https://www.ti.com/general/docs/suppproductinfo.tsp?distId=10&gotoUrl=https%3A%2F%2Fwww.ti.com%2Flit%2Fgpn%2Ftps61023
U36 = TPS2113ADRBR: IC OR CTRLR SRC SELECT 8SON; Mfr_Name: Texas Instruments; Current - Output (Max): 1.25A; Voltage - Supply: 2.8V ~ 5.5V; MPN: TPS2113ADRBR; Type: Source Selector Switch; ComponentLink1Description: DigiKey; ComponentLink1URL: https://www.digikey.com/en/products/detail/texas-instruments/TPS2113ADRBR/2353703?s=N4IgTCBcDaICoAUDKYCMqDMBBAIgJQCE8QBdAXyA; ComponentLink2Description: Datasheet; ComponentLink2URL: https://www.ti.com/general/docs/suppproductinfo.tsp?distId=10&gotoUrl=https%3A%2F%2Fwww.ti.com%2Flit%2Fgpn%2Ftps2113a

## Sheet RTC.SchDoc
size A4; SheetNumber: 16; SheetTotal: 16
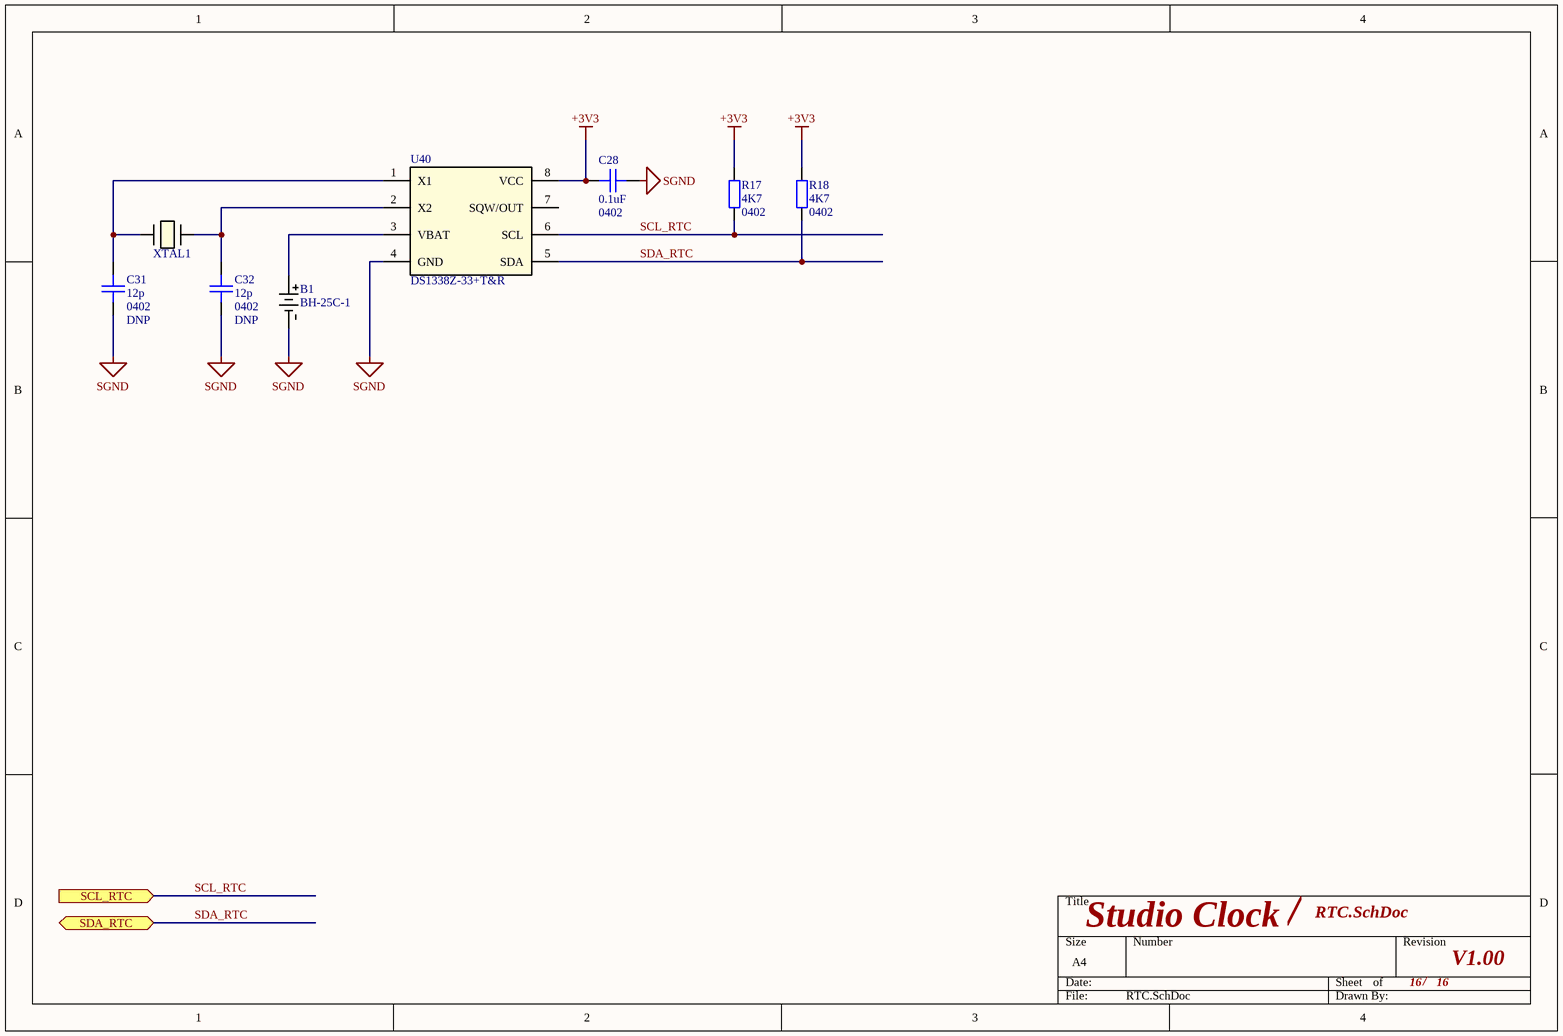
[diagram p15: RTC.SchDoc]

### Parts
B1  BH-25C-1  [BH-25C-1_ADM]
C28  Capacitance: 0.1uF  Package1: 0402  [CAPC100x50x50L25]  (hidden comment: 04023C104KAT2A)
C31  Capacitance: 12p  Package1: 0402  [CAPC100x50x50L25]  (hidden comment: CBR04C120F5GAC)
C32  Capacitance: 12p  Package1: 0402  [CAPC100x50x50L25]  (hidden comment: CBR04C120F5GAC)
R17  Resistance: 4K7  Package2: 0402  [RESC100X50X40L25]  (hidden comment: RC0402FR-074K7L)
R18  Resistance: 4K7  Package2: 0402  [RESC100X50X40L25]  (hidden comment: RC0402FR-074K7L)
U40  DS1338Z-33+T&R  [SOIC8P127_490X600X175L70X41]
XTAL1  FC2012AN 32.768K-90NN60KD7  [XTAL_FC2012AN_EPS]  (value not drawn)

### Ports
SCL_RTC (in), SDA_RTC (bidir)

### Nets
+3V3: C28.2 R17.2 R18.2 U40.8(VCC)
SGND: B1.1 C28.1 C31.1 C32.1 U40.4(GND)
SCL_RTC: R17.1 U40.6(SCL) ; port SCL_RTC
SDA_RTC: R18.1 U40.5(SDA) ; port SDA_RTC
NetB1_2: B1.2 U40.3(VBAT)
NetC31_2: C31.2 U40.1(X1) XTAL1.1
NetC32_2: C32.2 U40.2(X2) XTAL1.2

Not connected (* = marked no-connect by the designer): U40 7(SQW/OUT)

### Notes on the sheet
- /

### Library data of the parts
B1 = BH-25C-1: BATT HLDR COIN 20MM 1 CEL PC PIN; Mfr_Name: ADAM TECHNOLOGIES INC; Battery Series: 2032; MPN: BH-25C-1; DigiKey_URL: https://www.digikey.bg/en/products/detail/adam-tech/BH-25E-1/13537715; Datasheet_URL: https://app.adam-tech.com/products/download/data_sheet/196965/bh-25e-1-data-sheet.pdf
C28 = CMP-001-0374-4: as C1 on sheet POWER_Supply; ComponentLink3URL: https://www.digikey.com/en/products/detail/yageo/CC0402MRX5R5BB106/5195138; MPN: 04023C104KAT2A; ComponentLink1URL: https://www.yageo.com/upload/media/product/productsearch/datasheet/mlcc/UPY-GPHC_X5R_4V-to-50V_26.pdf; Package: 0402 (1005 Metric); Size: 1.00mm x 0.50mm; Height max: 700µm; Mounting Type: SM; Tolerance: 10%; ComponentLink1Description: Datasheet; ComponentLink3Description: Digikey; Ratings: -; Dielectric: X7R; ComponentLink2Description: Mouser; ComponentLink2URL: https://eu.mouser.com/ProductDetail/YAGEO/CC0402MRX5R5BB106?qs=zEY9bCHj09eCmUJdZuS5Lg%3D%3D; Lead Spacing: 0mm; Component Type: Ceramic Capacitor; Voltage Rating: 25V
C31 C32 = CMP-001-0374-4: CAP CER 12PF 50V C0G/NP0 0402; Manufacturer: KEMET; Op Temp max: 55°C; Op Temp min: -125°C; Tolerance: ±1%; Dielectric: C0G, NP0; MPN: CBR04C120F5GAC; Package: 0402 (1005 Metric); Size: 1.00mm x 0.50mm; Height max: 700µm; Mounting Type: SM; ComponentLink1Description: Datasheet; ComponentLink3Description: Digikey; Ratings: -; Lead Spacing: 0mm; Component Type: Ceramic Capacitor; Voltage Rating: 50V; DNP: DNP
  C31: ComponentLink3URL: https://www.digikey.ee/en/products/detail/kemet/CBR04C949B5GAC/7649438?s=N4IgTCBcDaIMICEBKAGALHAnGzCCsA4gIJwgC6AvkA; ComponentLink1URL: https://connect.kemet.com:7667/gateway/IntelliData-ComponentDocumentation/1.0/download/datasheet/CBR04C120F5GAC
  C32: ComponentLink3URL: https://www.digikey.com/en/products/detail/yageo/CC0402MRX5R5BB106/5195138; ComponentLink1URL: https://www.yageo.com/upload/media/product/productsearch/datasheet/mlcc/UPY-GPHC_X5R_4V-to-50V_26.pdf; ComponentLink2Description: Mouser; ComponentLink2URL: https://eu.mouser.com/ProductDetail/YAGEO/CC0402MRX5R5BB106?qs=zEY9bCHj09eCmUJdZuS5Lg%3D%3D
R17 R18 = CMP-001-0484-6: RES 4K7 OHM 1% 1/16W 0402; Manufacturer: YAGEO; Power: 63mW; Op Temp min: -55°C; Temperature Coefficient: ±100ppm; Op Temp max: 155°C; ComponentLink3URL: https://www.digikey.com/en/products/detail/yageo/RC0402FR-0727RL/5280946; ComponentLink2Description: Mouser; Ratings: -; Tolerance: 1%; Height max: 400µm; MPN: RC0402FR-074K7L; ComponentLink1URL: https://www.yageo.com/upload/media/product/productsearch/datasheet/rchip/PYu-RC_Group_51_RoHS_L_12.pdf; Size: 1.00mm x 0.50mm; Composition: Thick Film; Package: 0402 (1005 Metric); ComponentLink3Description: Digikey; Mounting Type: SM; ComponentLink2URL: https://eu.mouser.com/ProductDetail/YAGEO/RC0402FR-0727RL?qs=UOUeRUa%252B8Wlb37UyFHw9Bw%3D%3D; ComponentLink1Description: Datasheet; Component Type: Chip Resistor
U40 = DS1338Z-33+TR: IC RTC CLK/CALENDAR I2C 8SOIC; Voltage - Supply: 3V ~ 5.5V; Voltage - Supply, Battery: 1.3V ~ 3.7V; MFN: DS1338Z-33+T&R; ComponentLink1Description: Datasheet; ComponentLink1URL: https://www.analog.com/media/en/technical-documentation/data-sheets/DS1338-DS1338Z.pdf; Package: SOIC-8; ComponentLink2Description: DigiKey; ComponentLink2URL: https://www.digikey.ee/en/products/detail/analog-devices-inc-maxim-integrated/DS1338Z-33-T-R/1196924; Operating Temperature MAX: + 85°C; Operating Temperature MIN: -40°C
XTAL1 = FC2012AN 32.768K-90NN60KD7: CRYSTAL 32.7680KHZ 9PF SMD; Mfr_Name: Epson; Frequency: 32.768 kHz; MPN: FC2012AN 32.768K-90NN60KD7

## Nets that join several sheets
+3V3: Q_Light_CTRL1 (5 pins), SWITCH_CTRL1 (6 pins), MP_CTRL1 (C33.2 J1.1), AM_PM_Indicator (12 pins), Clock_7Segment (11 pins), VIDEO_Interface (C77.2 R200.1 U31.8), POWER_Supply (C27.2 C85.2 U2.5 U37.6), RTC (C28.2 R17.2 R18.2 U40.8)
+5V: Q_Light_CTRL1 (R128.2), MP_CTRL1 (6 pins), AM_PM_Indicator (23 pins), POWER_Supply (7 pins), BACKUP_Power (R154.2 U36.7)
+5V_IN: POWER_Supply (5 pins), BACKUP_Power (9 pins)
+12V_Q: Q_Light_CTRL1 (6 pins), POWER_Supply (F1.1 R124.2)
GND_SIGNAL: POE_PSU (12 pins), PD Buck (9 pins)
PDN_RTN: POE_PD (26 pins), PD Buck (R87.2 R88.2)
PSU_RTN_DNP: POE_PSU (17 pins), POE_PD (C45.2 L3.3 R110.1)
SGND: _TOP_List (J10.2), Q_Light_CTRL1 (16 pins), SWITCH_CTRL1 (20 pins), MP_CTRL1 (30 pins), AM_PM_Indicator (24 pins), Clock_7Segment (32 pins), VIDEO_Interface (7 pins), POWER_Supply (22 pins), BACKUP_Power (20 pins), RTC (5 pins)
12V0_DNP: POE (F2.2), POE_PSU (C55.2 L4.1 R122.2)
AM_PM_CTRL: MP_CTRL1 (U16.38), AM_PM_Indicator (R171.2)
BAT_ON: MP_CTRL1 (U16.24), POWER_Supply (R16.1 R161.2)
GREEN_CTRL_IN: Q_Light_CTRL1 (J5.2 U11.2 U27.2), MP_CTRL1 (U16.33)
GREEN_SEL: AM_PM_Indicator (Q1.5 Q1.6 Q1.7 Q1.8), Clock_7Segment (8 pins)
H_LED_CTRL: MP_CTRL1 (U16.40), AM_PM_Indicator (R173.2)
IN_0: SWITCH_CTRL1 (U30.2), MP_CTRL1 (U16.31)
IN_1: SWITCH_CTRL1 (U30.4), MP_CTRL1 (U16.26)
IN_2: SWITCH_CTRL1 (U30.6), MP_CTRL1 (U16.37)
IN_3: SWITCH_CTRL1 (U30.8), MP_CTRL1 (U16.29)
LED_RESET: MP_CTRL1 (U16.7), Clock_7Segment (U50.25 U51.25 U52.25 U53.25)
LTC_GPIO: MP_CTRL1 (U16.28), VIDEO_Interface (R201.1 U31.1)
PD_GD_DNP: POE_PSU (R112.2 R114.1 U23.7), POE_PD (R104.2)
PSU_VIN_DNP: POE_PSU (9 pins), POE_PD (C45.1 L3.2 R97.1)
PWM_CTRL_GREEN: MP_CTRL1 (U16.12), AM_PM_Indicator (R175.2)
PWM_CTRL_RED: MP_CTRL1 (U16.35), AM_PM_Indicator (R177.2)
RED_CTRL_IN: Q_Light_CTRL1 (J5.1 U10.2 U27.1), MP_CTRL1 (U16.32)
RED_SEL: AM_PM_Indicator (Q2.5 Q2.6 Q2.7 Q2.8), Clock_7Segment (8 pins)
SCL_RTC: MP_CTRL1 (U16.5), Clock_7Segment (U50.26 U51.26 U52.26 U53.26), RTC (R17.1 U40.6)
SDA_RTC: MP_CTRL1 (U16.3), Clock_7Segment (U50.27 U51.27 U52.27 U53.27), RTC (R18.1 U40.5)
UART1_RX_IN: Q_Light_CTRL1 (R198.2), MP_CTRL1 (U16.10)
UART1_TX_IN: Q_Light_CTRL1 (R130.2), MP_CTRL1 (U16.8)
UART2_RX_OUT: Q_Light_CTRL1 (R206.2), MP_CTRL1 (U16.11)
UART2_TX_OUT: Q_Light_CTRL1 (R205.2), MP_CTRL1 (U16.13)